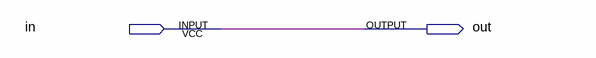
[diagram p0: schematic sheet]
// Quartus schematic TopLevelTest.bdf as structural Verilog: 0 symbols, 2 pins
module TopLevelTest (
  input  in,
  output out
);


  assign out = in;
endmodule
